# EasyEDA Pro project PET_LAB_PCB_Rev3.eprj, schematic Schematic1

## Sheets
1 P1: Board Name: Board1; Create Date: 2025-12-09; Page Name: P1; Project Name: PET_LAB_PCB_Rev3; Schematic Name: Schematic1; Update Date: 2025-12-10; Company: EasyEDA.com; Page Size: A4; Version: V2.0
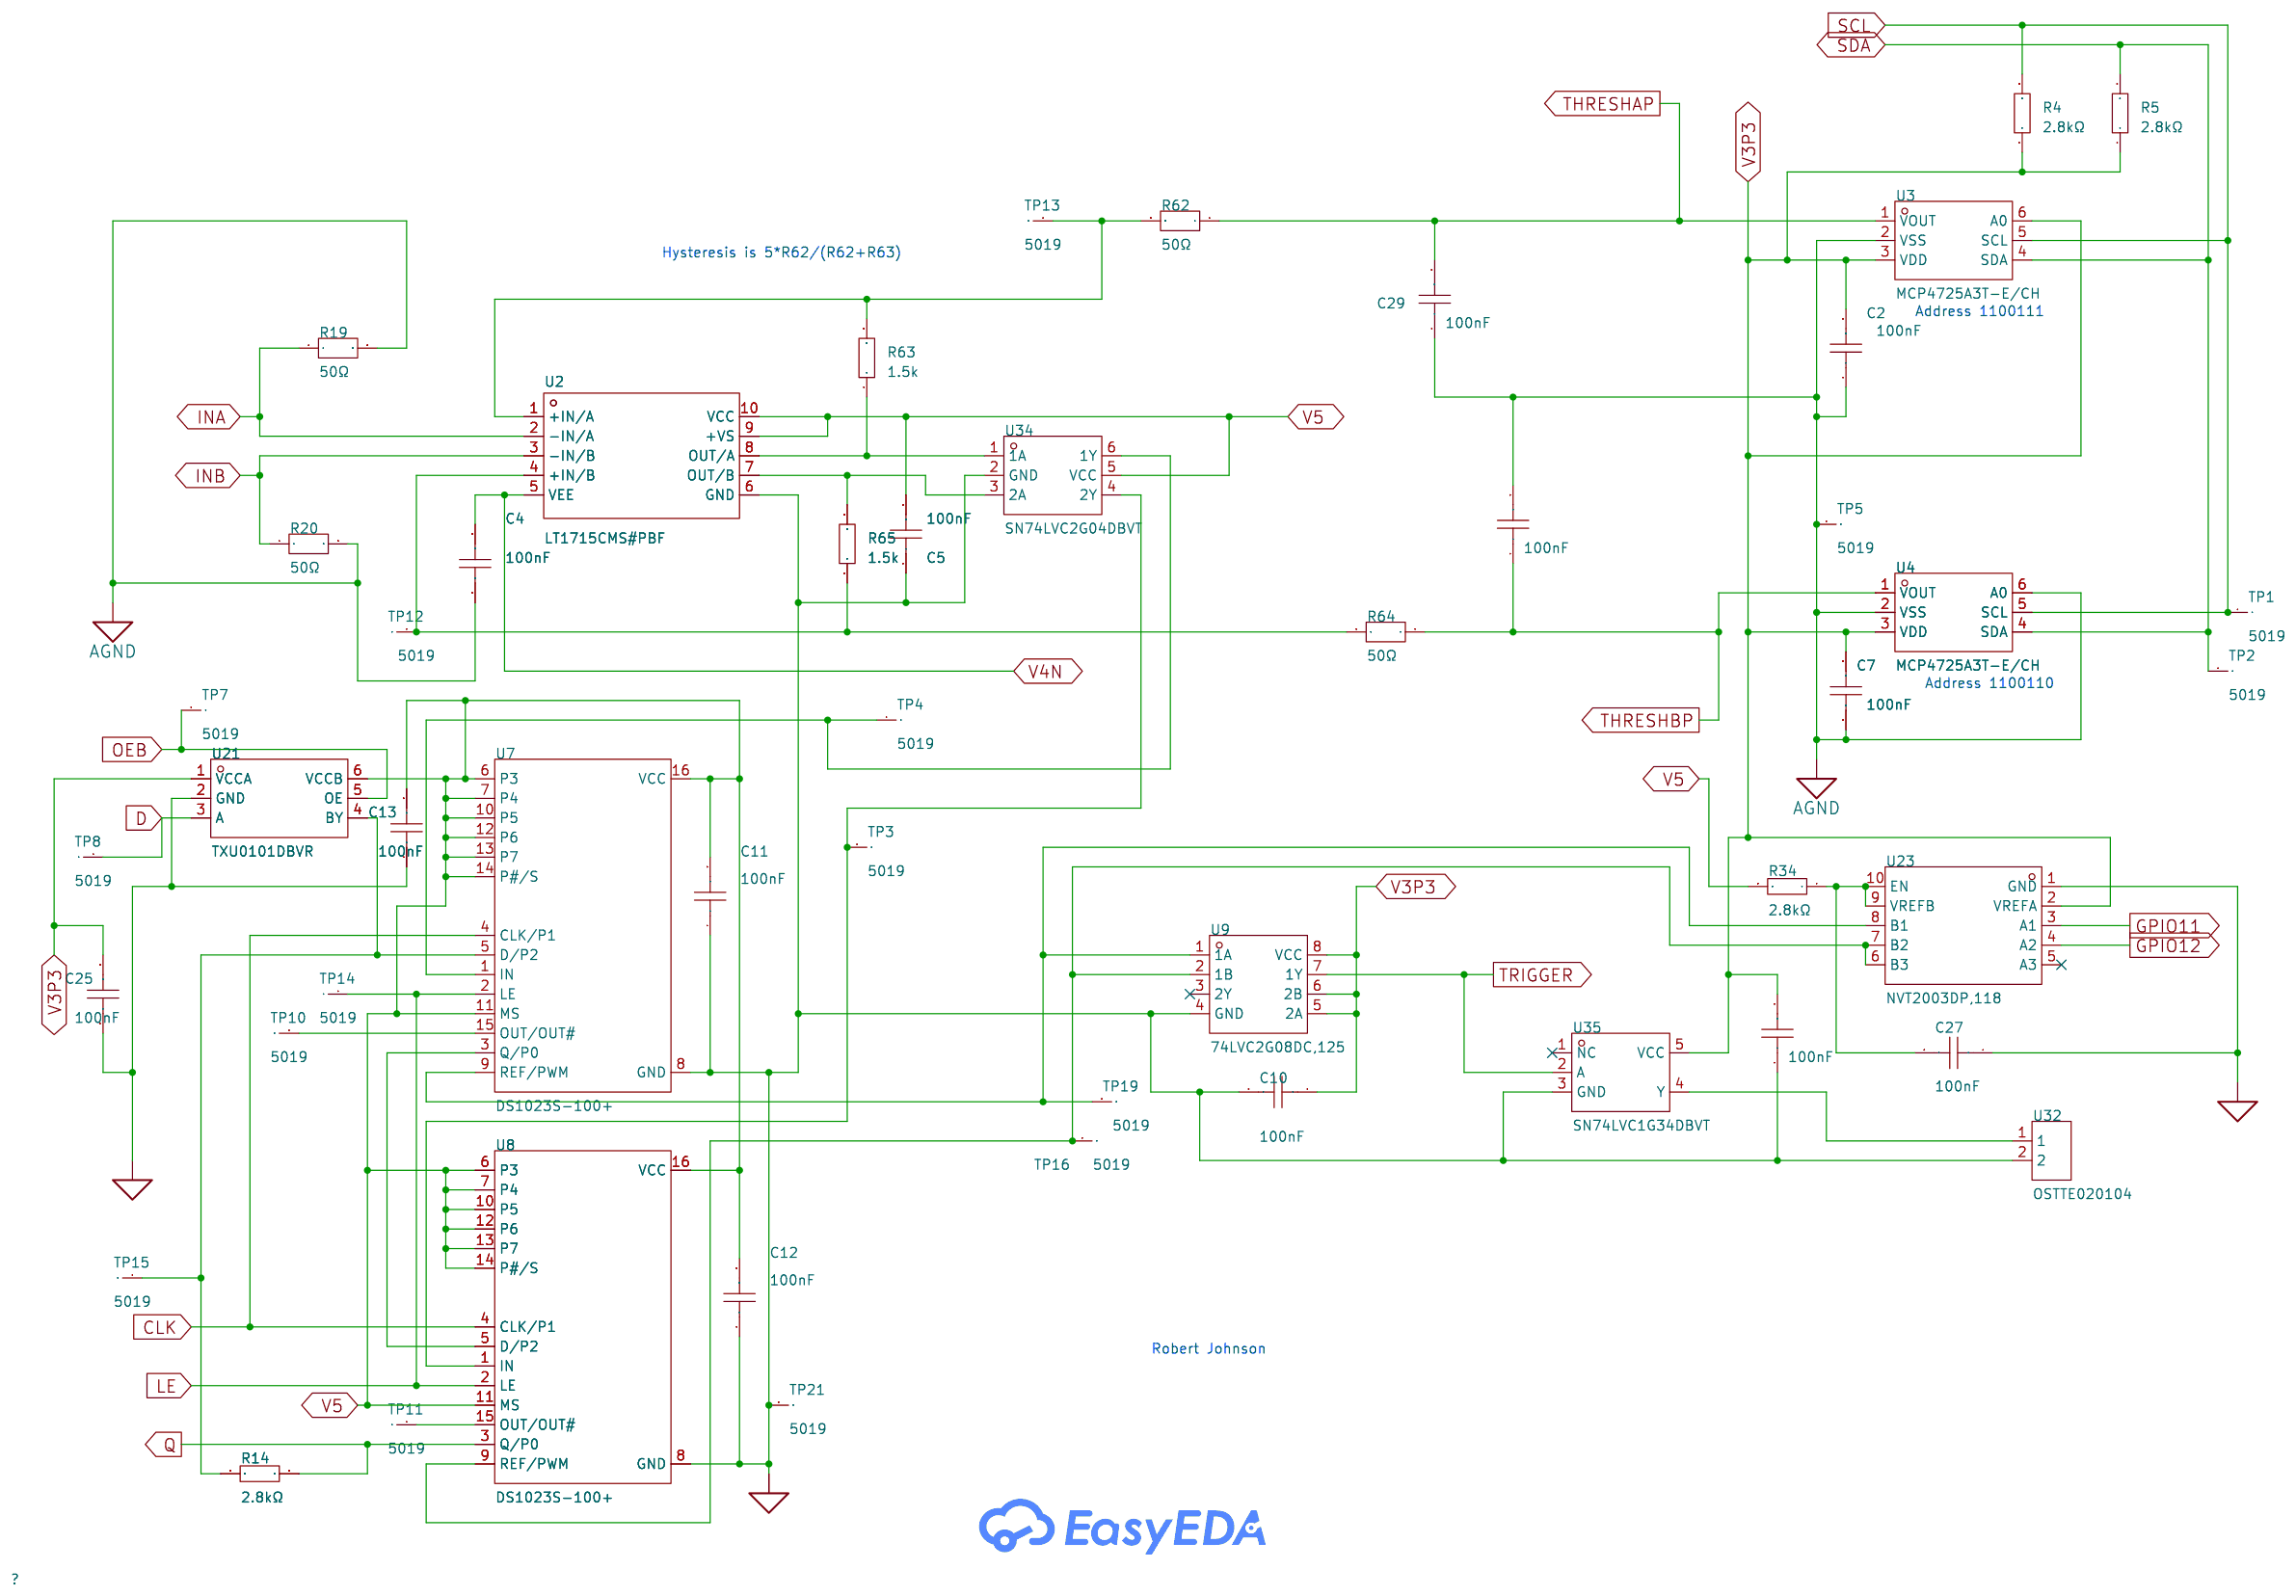
[diagram p0: P1]
2 P2: Page Name: P2; Update Date: 2026-10-26
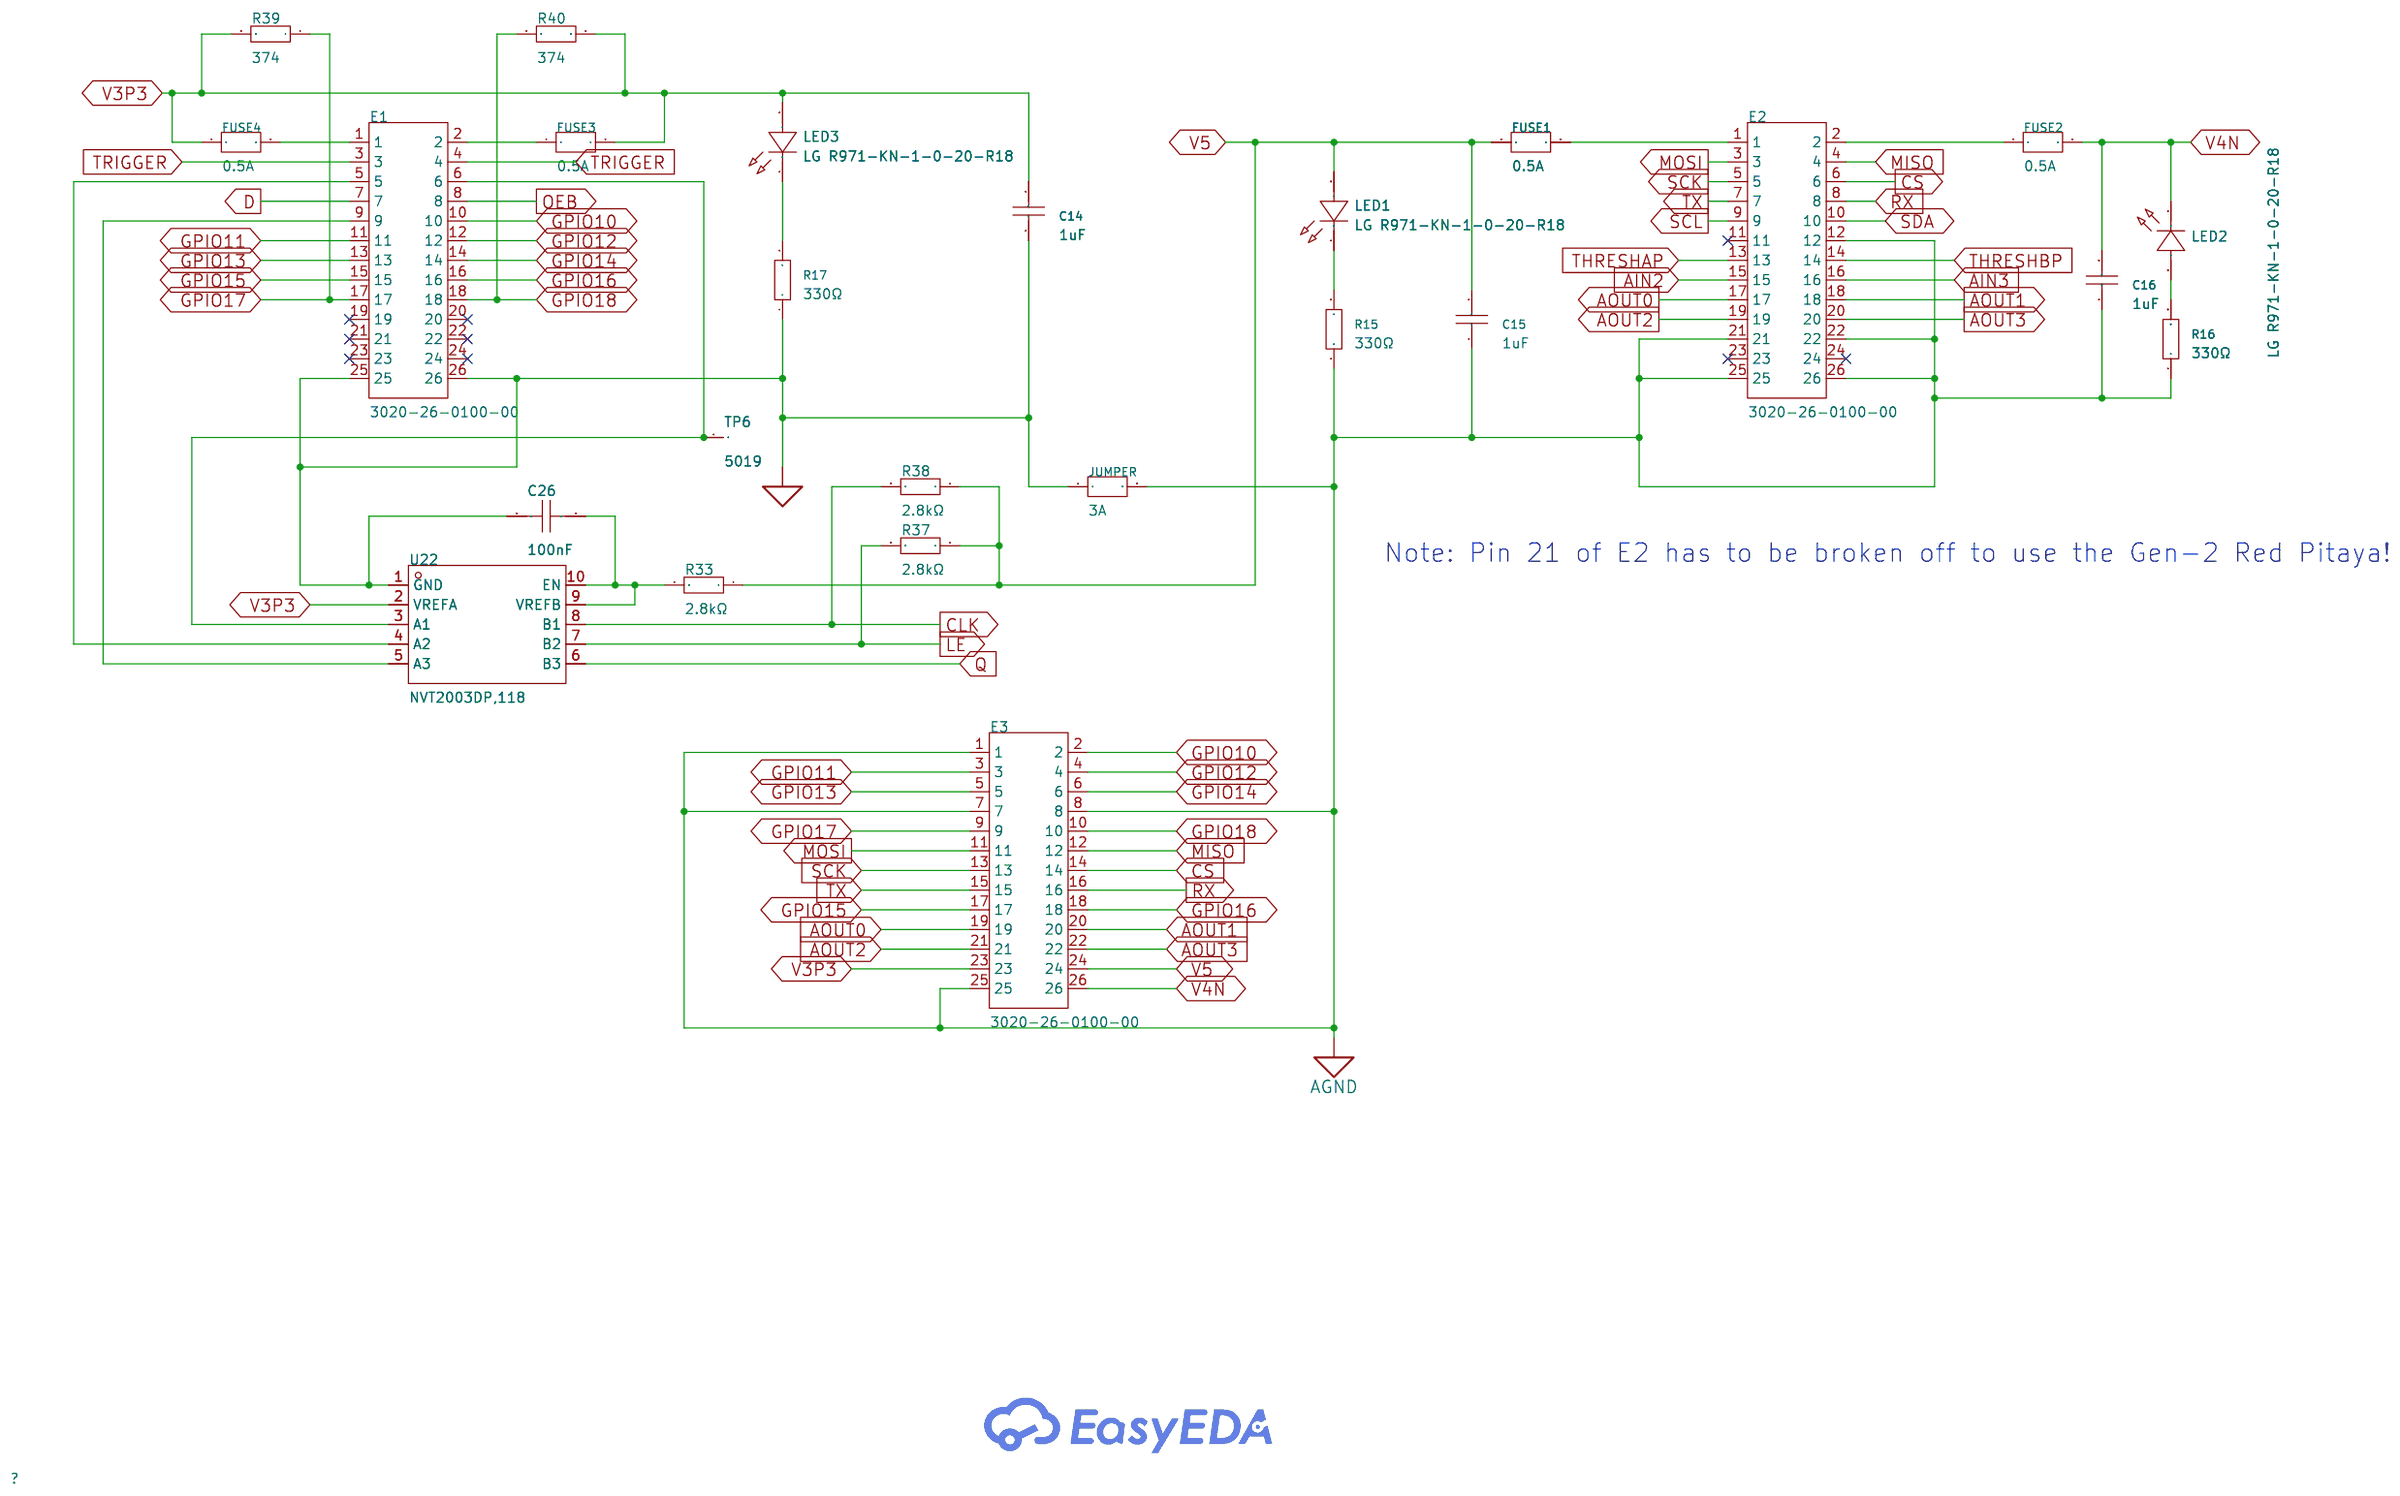
[diagram p1: P2]
3 P3: Page Name: P3
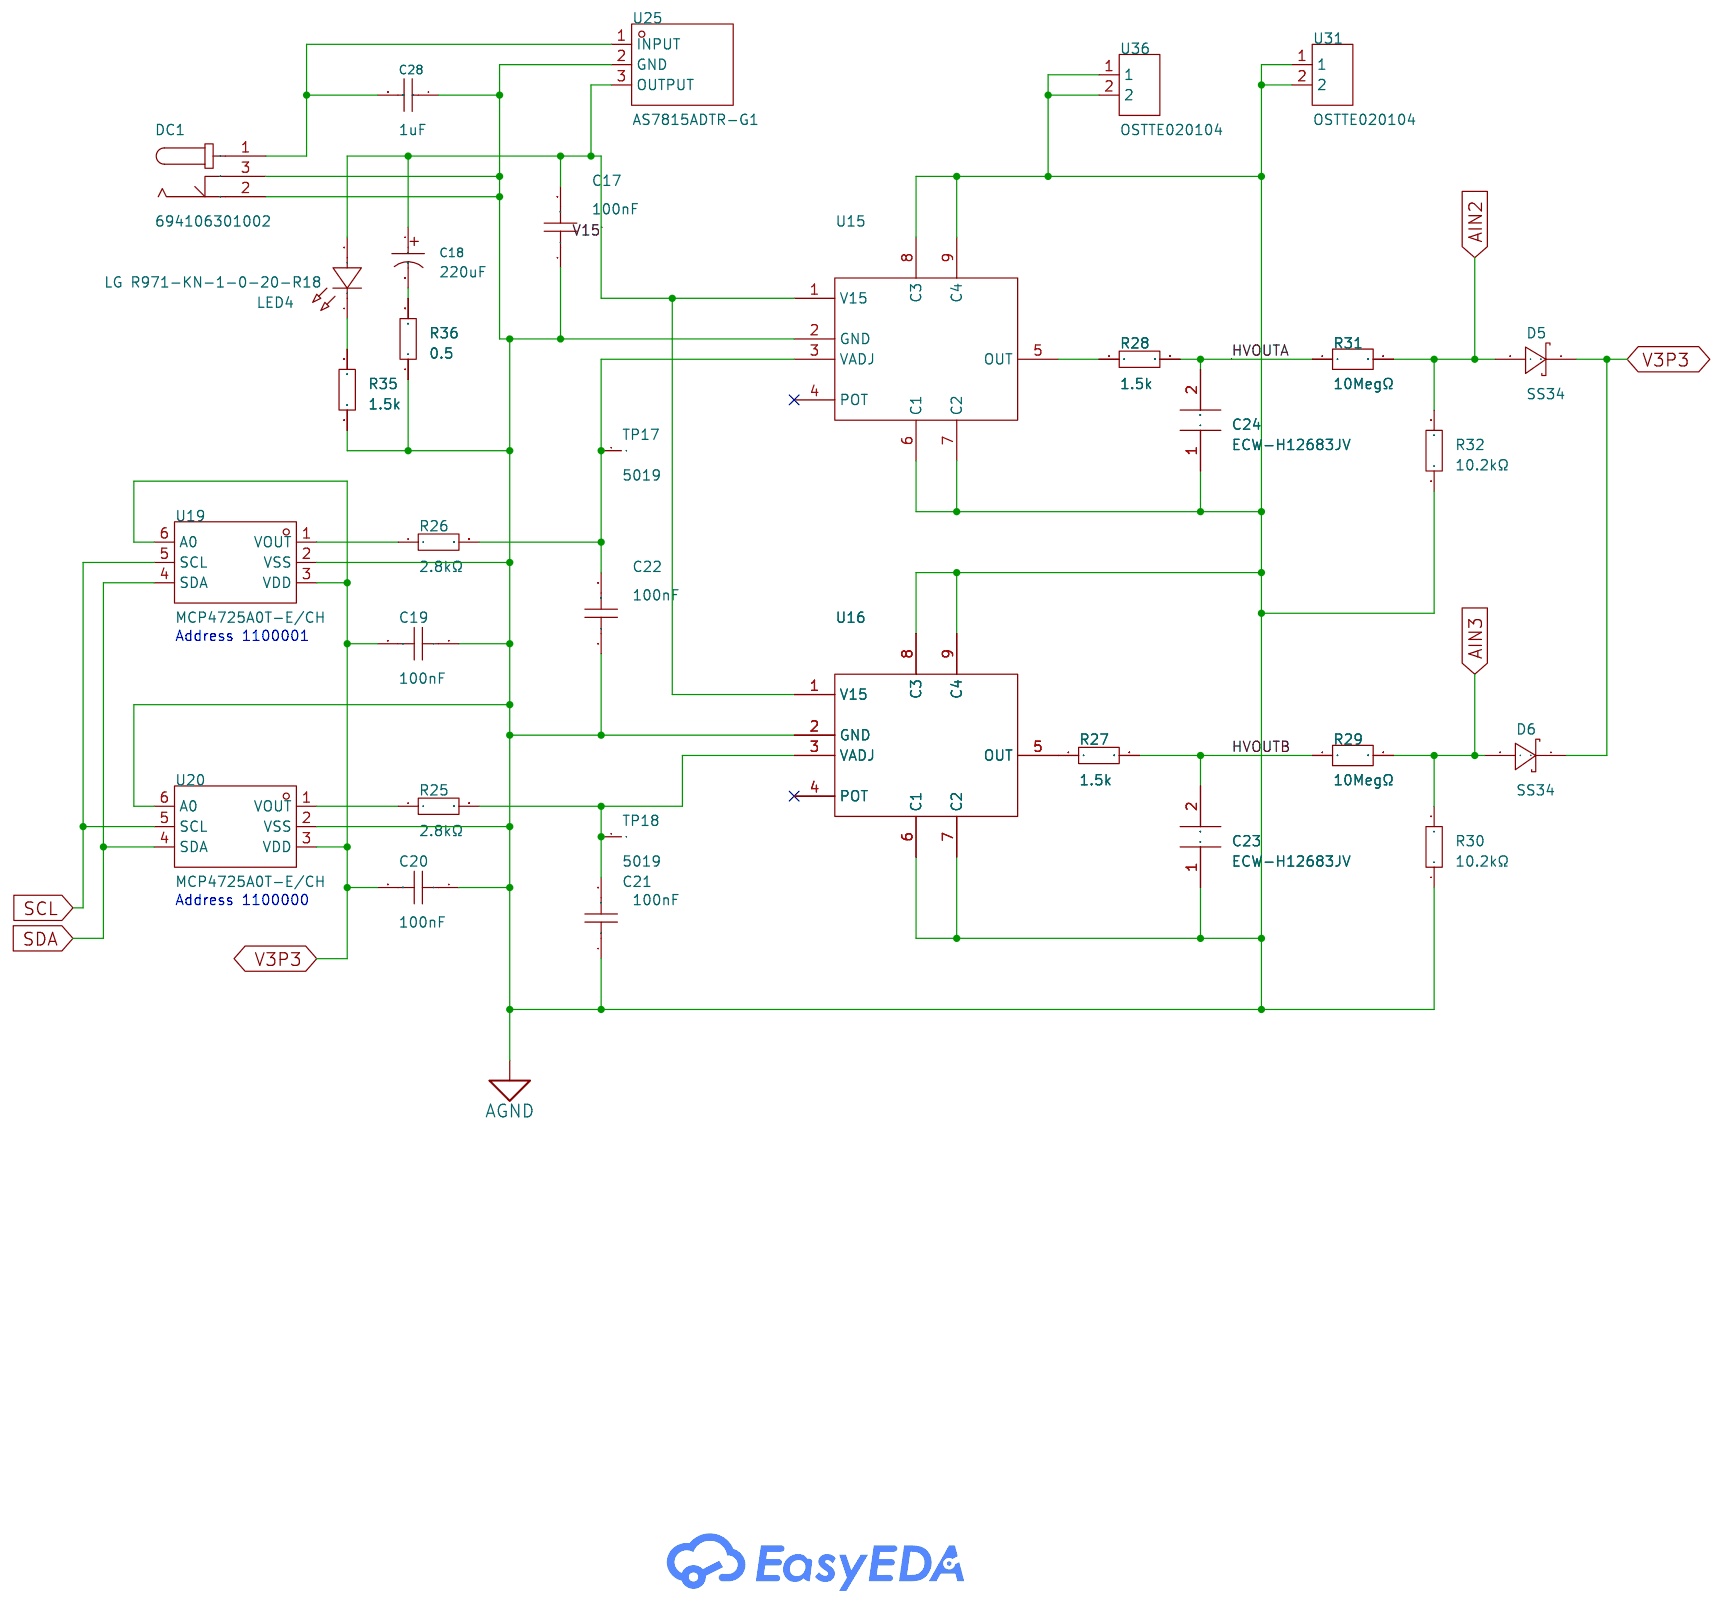
[diagram p2: P3]
4 P4: Page Name: P4; Version: V1.0
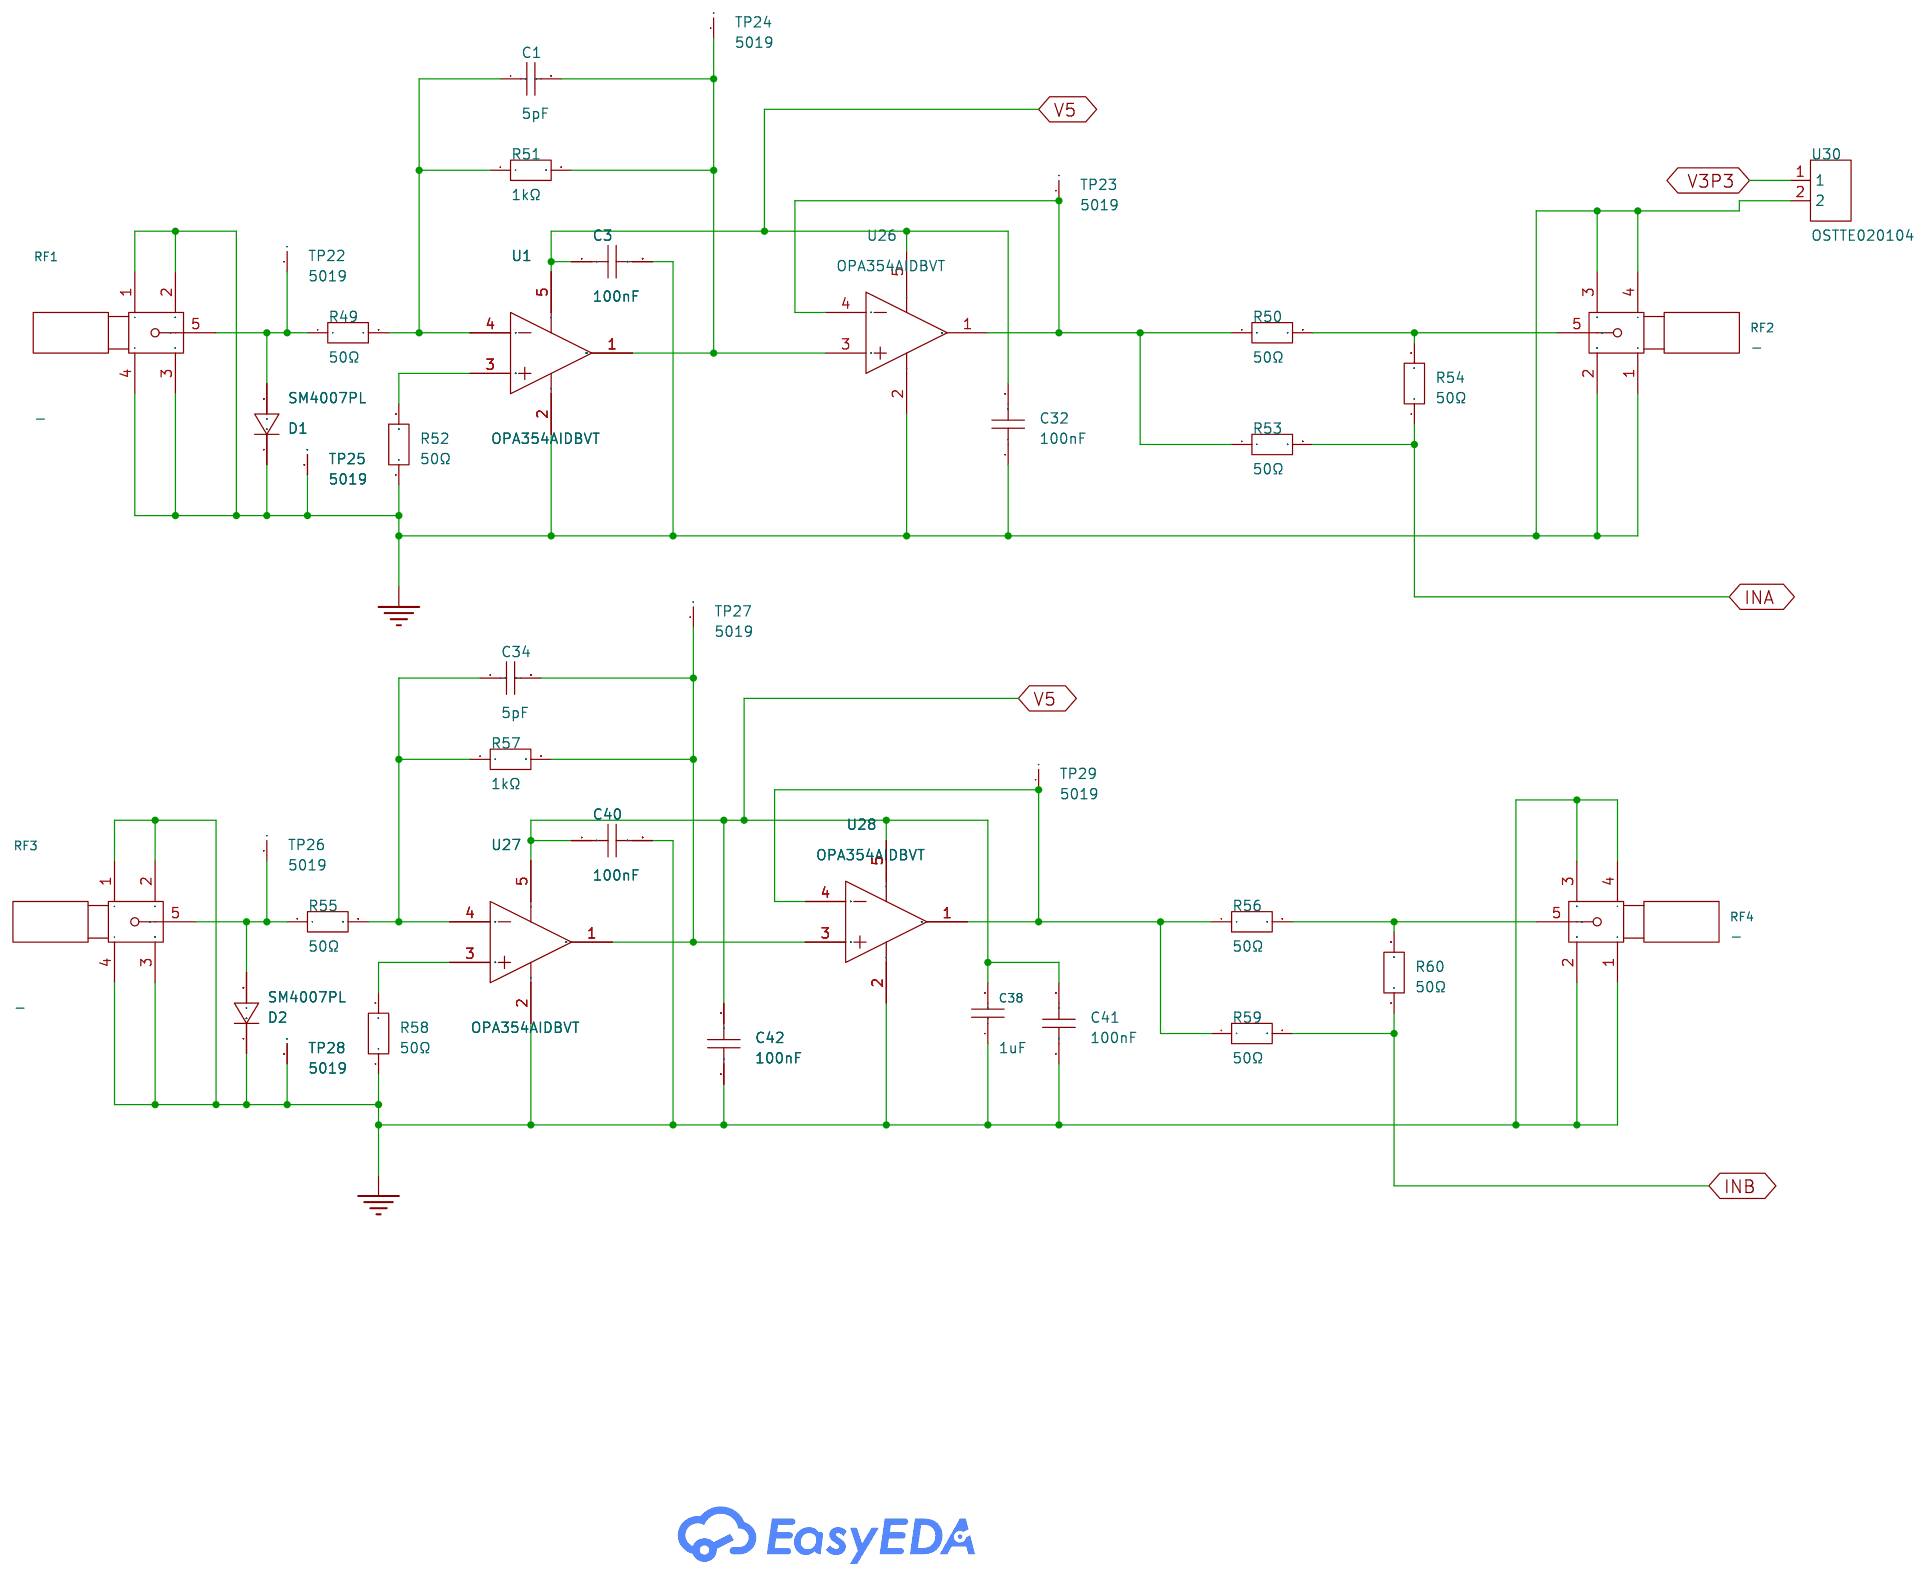
[diagram p3: P4]

## Parts
sheet P1
C2  100nF  [C0603]
C4  100nF  [C0603]
C5  100nF  [C0603]
C7  100nF  [C0603]
C10  100nF  [C0603]
C11  100nF  [C0603]
C12  100nF  [C0603]
C13  100nF  [C0603]
C25  100nF  [C0603]
C27  100nF  [C0603]
C29  100nF  [C0603]
C30  100nF  [C0603]
C39  100nF  [C0603]
R4  2.8kΩ  [R0805]
R5  2.8kΩ  [R0805]
R14  2.8kΩ  [R0805]
R19  50Ω  [R0805]
R20  50Ω  [R0805]
R34  2.8kΩ  [R0805]
R62  50Ω  [R0805]
R63  1.5k  [R0805]
R64  50Ω  [R0805]
R65  1.5k  [R0805]
TP1  5019  [CONN-SMD_5019]
TP2  5019  [CONN-SMD_5019]
TP3  5019  [CONN-SMD_5019]
TP4  5019  [CONN-SMD_5019]
TP5  5019  [CONN-SMD_5019]
TP7  5019  [CONN-SMD_5019]
TP8  5019  [CONN-SMD_5019]
TP10  5019  [CONN-SMD_5019]
TP11  5019  [CONN-SMD_5019]
TP12  5019  [CONN-SMD_5019]
TP13  5019  [CONN-SMD_5019]
TP14  5019  [CONN-SMD_5019]
TP15  5019  [CONN-SMD_5019]
TP16  5019  [CONN-SMD_5019]
TP19  5019  [CONN-SMD_5019]
TP21  5019  [CONN-SMD_5019]
U2  LT1715CMS#PBF  [MSOP-10_L3.0-W3.0-P0.50-LS5.0-TL]
U3  MCP4725A3T-E/CH  [SOT-23-6_L2.9-W1.6-P0.95-LS2.8-BR]
U4  MCP4725A3T-E/CH  [SOT-23-6_L2.9-W1.6-P0.95-LS2.8-BR]
U7  DS1023S-100+  [SOIC-16_L10.3-W7.5-P1.27-LS10.4-BL]
U8  DS1023S-100+  [SOIC-16_L10.3-W7.5-P1.27-LS10.4-BL]
U9  74LVC2G08DC,125  [VSSOP-8_L2.3-W2.0-P0.50-LS3.1-BL]
U21  TXU0101DBVR  [SOT-23-6_L2.9-W1.6-P0.95-LS2.8-BL-1]
U23  NVT2003DP,118  [TSSOP-10_L3.0-W3.0-P0.50-LS4.9-BL]
U32  OSTTE020104  [CONN-TH_2P-P3.50_OSTTE020104]
U34  SN74LVC2G04DBVT  [SOT-23-6_L2.9-W1.6-P0.95-LS2.8-BR]
U35  SN74LVC1G34DBVT  [TSOT-23-5_L2.9-W1.6-P0.95-LS2.8-BL]
sheet P2
C14  1uF  [C0805]
C15  1uF  [C0805]
C16  1uF  [C0805]
C26  100nF  [C0603]
E1  3020-26-0100-00  [HDR-TH_26P-P2.54-V-M-R2-C13-S2.54]
E2  3020-26-0100-00  [HDR-TH_26P-P2.54-V-M-R2-C13-S2.54]
E3  3020-26-0100-00  [HDR-TH_26P-P2.54-V-M-R2-C13-S2.54]
FUSE1  0.5A  [R1206]
FUSE2  0.5A  [R1206]
FUSE3  0.5A  [R1206]
FUSE4  0.5A  [R1206]
JUMPER  3A  [R1206]
LED1  LG R971-KN-1-0-20-R18  [LED0805-RD_GREEN]
LED2  LG R971-KN-1-0-20-R18  [LED0805-RD_GREEN]
LED3  LG R971-KN-1-0-20-R18  [LED0805-RD_GREEN]
R15  330Ω  [R0805]
R16  330Ω  [R0805]
R17  330Ω  [R0805]
R33  2.8kΩ  [R0805]
R37  2.8kΩ  [R0805]
R38  2.8kΩ  [R0805]
R39  374  [R0805]
R40  374  [R0805]
TP6  5019  [CONN-SMD_5019]
U22  NVT2003DP,118  [TSSOP-10_L3.0-W3.0-P0.50-LS4.9-BL]
sheet P3
C17  100nF  [C0603]
C18  220uF  [CAP-SMD_BD8.0-L8.3-W8.3-FD]
C19  100nF  [C0603]
C20  100nF  [C0603]
C21  100nF  [C0603]
C22  100nF  [C0603]
C23  0.068u  [HV_CAP_ECW-H12683JV]
C24  0.068u  [HV_CAP_ECW-H12683JV]
C28  1uF  [C0805]
D5  SS34  [SOD-323_L1.8-W1.3-LS2.5-RD]
D6  SS34  [SOD-323_L1.8-W1.3-LS2.5-RD]
DC1  694106301002  [DC-IN-TH_694106301002]
LED4  LG R971-KN-1-0-20-R18  [LED0805-RD_GREEN]
R25  2.8kΩ  [R0805]
R26  2.8kΩ  [R0805]
R27  1.5k  [R0805]
R28  1.5k  [R0805]
R29  10MegΩ  [R2512]
R30  10.2kΩ  [R0805]
R31  10MegΩ  [R2512]
R32  10.2kΩ  [R0805]
R35  1.5k  [R0805]
R36  0.5  [R0805]
TP17  5019  [CONN-SMD_5019]
TP18  5019  [CONN-SMD_5019]
U15  C9619-50  [HPK_C9619-50]
U16  C9619-50  [HPK_C9619-50]
U19  MCP4725A0T-E/CH  [SOT-23-6_L2.9-W1.6-P0.95-LS2.8-BR]
U20  MCP4725A0T-E/CH  [SOT-23-6_L2.9-W1.6-P0.95-LS2.8-BR]
U25  AS7815ADTR-G1  [TO-252-2_L6.6-W6.1-P4.57-LS9.9-BR-CW]
U31  OSTTE020104  [CONN-TH_2P-P3.50_OSTTE020104]
U36  OSTTE020104  [CONN-TH_2P-P3.50_OSTTE020104]
sheet P4
C1  5pF  [C0603]
C3  100nF  [C0603]
C32  100nF  [C0603]
C34  5pF  [C0603]
C38  1uF  [C0805]
C40  100nF  [C0603]
C41  100nF  [C0603]
C42  100nF  [C0603]
D1  SM4007PL  [SOD-123F_L2.8-W1.8-LS3.7-RD]
D2  SM4007PL  [SOD-123F_L2.8-W1.8-LS3.7-RD]
R49  50Ω  [R0603]
R50  50Ω  [R0603]
R51  1kΩ  [R0603]
R52  50Ω  [R0603]
R53  50Ω  [R0603]
R54  50Ω  [R0603]
R55  50Ω  [R0603]
R56  50Ω  [R0603]
R57  1kΩ  [R0603]
R58  50Ω  [R0603]
R59  50Ω  [R0603]
R60  50Ω  [R0603]
RF1  -  [SMA-TH_BWSMA-KWE-Z001]
RF2  -  [SMA-TH_BWSMA-KWE-Z001]
RF3  -  [SMA-TH_BWSMA-KWE-Z001]
RF4  -  [SMA-TH_BWSMA-KWE-Z001]
TP22  5019  [CONN-SMD_5019]
TP23  5019  [CONN-SMD_5019]
TP24  5019  [CONN-SMD_5019]
TP25  5019  [CONN-SMD_5019]
TP26  5019  [CONN-SMD_5019]
TP27  5019  [CONN-SMD_5019]
TP28  5019  [CONN-SMD_5019]
TP29  5019  [CONN-SMD_5019]
U1  OPA354AIDBVT  [SOT-23-5_L3.0-W1.7-P0.95-LS2.8-BR]
U26  OPA354AIDBVT  [SOT-23-5_L3.0-W1.7-P0.95-LS2.8-BR]
U27  OPA354AIDBVT  [SOT-23-5_L3.0-W1.7-P0.95-LS2.8-BR]
U28  OPA354AIDBVT  [SOT-23-5_L3.0-W1.7-P0.95-LS2.8-BR]
U30  OSTTE020104  [CONN-TH_2P-P3.50_OSTTE020104]

## Library data of the parts
C2 C4 C5 C7 C10-C13 C17 C19-C22 C25-C27 C29 C30 C39 = CC0603JRX7R7BB104: Capacitance: Tolerance:±5% Tolerance:±5% Voltage Rated: Temperature Coefficient:; LCSC Part Name: 100nF ±5% 16V; Supplier Part: 311-1344-1-ND; Manufacturer: YAGEO; Manufacturer Part: CC0603KRX7R9BB104; Supplier Footprint: 0603; JLCPCB Part Class: Extended Part; Datasheet: https://atta.szlcsc.com/upload/public/pdf/source/20170919/C131031_1505787245477976978.pdf; Supplier: Digikey; Tolerance: ±5%
R4 R5 R14 R25 R26 R33 R34 R37 R38 = AC0805FR-072K8L: Type:Thick Film Resistors Resistance: Tolerance:±1% Tolerance:±1% Power(Watts): Overload Voltage (Max): Temperature Coefficient:±100ppm/℃ Temperature Coefficient:±100ppm/℃ Operating Temperature Range:-55℃~+155℃ Operating Temperature Range:-55℃~+155℃; LCSC Part Name: 厚膜电阻 2.8kΩ ±1% 125mW; Supplier Part: RMCF0805FT2K80CT-ND; Manufacturer: Stackpole Electronics; Manufacturer Part: RMCF0805FT2K80; Supplier Footprint: 0805; JLCPCB Part Class: Extended Part; Datasheet: https://atta.szlcsc.com/upload/public/pdf/source/20181031/C228707_23E607B250457FE629CF9918DB05DE4F.pdf; Supplier: Digikey; Type: Thick Film Resistors; Tolerance: ±1%; Temperature Coefficient: ±100ppm/℃; Operating Temperature Range: -55℃~+155℃
R19 R20 R62 R64 = RC0805FR-0750RL: Type:Thick Film Resistors Resistance: Tolerance:±1% Tolerance:±1% Power(Watts): Overload Voltage (Max): Temperature Coefficient:±100ppm/℃ Temperature Coefficient:±100ppm/℃ Operating Temperature Range:-55℃~+155℃ Operating Temperature Range:-55℃~+155℃; LCSC Part Name: 厚膜电阻 50Ω ±1% 125mW; Supplier Part: 541-CRCW080550R0FKTACT-ND; Manufacturer: Vishay Dale; Manufacturer Part: CRCW080550R0FKTA; Supplier Footprint: 0805; JLCPCB Part Class: Extended Part; Datasheet: https://atta.szlcsc.com/upload/public/pdf/source/20200615/C131893_A604F8AF35D98EE84B5E22CA559D5C95.pdf; Supplier: Digikey; Type: Thick Film Resistors; Tolerance: ±1%; Temperature Coefficient: ±100ppm/℃; Operating Temperature Range: -55℃~+155℃
R27 R28 R35 R63 R65 = AC0805FR-0710K2L: Type:Thick Film Resistors Resistance: Tolerance:±1% Tolerance:±1% Power(Watts): Overload Voltage (Max): Temperature Coefficient:±100ppm/℃ Temperature Coefficient:±100ppm/℃ Operating Temperature Range:-55℃~+155℃ Operating Temperature Range:-55℃~+155℃; LCSC Part Name: 厚膜电阻 10.2kΩ ±1% 125mW; Supplier Part: 13-AC0805FR-0710K2L-ND; Manufacturer: YAGEO(国巨); Supplier Footprint: 0805; JLCPCB Part Class: Extended Part; Datasheet: https://atta.szlcsc.com/upload/public/pdf/source/20180927/C229861_4ABDC471507C1ED6AFB4BA66AFC8620A.pdf; Supplier: Digikey; Type: Thick Film Resistors; Tolerance: ±1%; Temperature Coefficient: ±100ppm/℃; Operating Temperature Range: -55℃~+155℃
TP1-TP8 TP10-TP19 TP21-TP29 = 5019: Connector Type:Iron ring type (patch) Plastic Color:No plastic Board Space (Diameter φ/ Length x Width):3mmx1.6mm; Supplier Part: 36-5019CT-ND; Manufacturer: Keystone; JLCPCB Part Class: Extended Part; Datasheet: https://atta.szlcsc.com/upload/public/pdf/source/20241111/B41DD7C4F217EFE2A4E662B9E95EFAE0.pdf; Supplier: Digikey; Connector Type: Iron ring type (patch); Plastic Color: No plastic; Board Space (Diameter φ/ Length x Width): 3mmx1.6mm
U2 = LT1715CMS#PBF: Input Offset Voltage (Vos):2.5mV Input Bias Current (Ib):6uA Input Hysteresis Voltage (Vhys):6mV Common Mode Rejection Ratio (CMRR):70dB Supply Voltage:2.7V~12V Supply Voltage:2.7V~12V Output Type:- Output Mode:TTL；CMOS Operating Temperature:0℃~+70℃ Opera; LCSC Part Name: 4纳秒，150兆赫双比较器，具有独立的输入/输出电源; Supplier Part: LT1715CMS#TRPBFCT-ND; Manufacturer: Analog Devices Inc; Supplier Footprint: MSOP-10; JLCPCB Part Class: Extended Part; Datasheet: https://atta.szlcsc.com/upload/public/pdf/source/20221018/7AC70F5A8AD203391C1E1D67A85126DA.pdf; Supplier: Digikey; Input Offset Voltage (Vos): 2.5mV; Input Bias Current (Ib): 6uA; Input Hysteresis Voltage (Vhys): 6mV; Common Mode Rejection Ratio (CMRR): 70dB; Supply Voltage: 2.7V~12V; Output Mode: TTL；CMOS; Operating Temperature: 0℃~+70℃
U3 U4 = MCP4725A3T-E/CH: Interface:I2C Number of Channels:1 Output Type:Voltage Buffer Supply Voltage:2.7V~5.5V Supply Voltage:2.7V~5.5V Resolution:12 Integral nonlinearity:±2LSB Integral nonlinearity:±2LSB Settling Time:6us Operating Temperature:-40℃~+125℃ Operating Temperature:; Supplier Part: MCP4725A3T; Manufacturer: Microchip Technology; Supplier Footprint: SOT-23-6; JLCPCB Part Class: Extended Part; Datasheet: https://atta.szlcsc.com/upload/public/pdf/source/20151029/1457707542566.pdf; Supplier: Digikey; Interface: I2C; Number of Channels: 1; Output Type: Voltage Buffer; Supply Voltage: 2.7V~5.5V; Resolution: 12; Integral nonlinearity: ±2LSB; Settling Time: 6us; Operating Temperature: -40℃~+125℃
U7 U8 = DS1023S-100+: Available Total Delays:255ns Available Total Delays:255ns Voltage - Supply:4.75V~5.25V Voltage - Supply:4.75V~5.25V Operating Temperature:0℃~+70℃ Operating Temperature:0℃~+70℃; LCSC Part Name: 8位、可编程定时单元; Supplier Part: DS1023S-100+-ND; Manufacturer: Analog Devices, Maxim; Supplier Footprint: SOIC-16-300mil; JLCPCB Part Class: Extended Part; Datasheet: https://atta.szlcsc.com/upload/public/pdf/source/20171204/C143276_15123771717071162548.pdf; Supplier: Digikey; Available Total Delays: 255ns; Voltage - Supply: 4.75V~5.25V; Operating Temperature: 0℃~+70℃
U9 = 74LVC2G08DC,125: Logic Gate Type:With Door Number of Channels:2 Supply Voltage:1.65V~5.5V Supply Voltage:1.65V~5.5V Quiescent Current (Max):4uA Sink Current:32mA Source Current:32mA High Level Range (VIH):950mV~3.4V High Level Range (VIH):950mV~3.4V Low Level Range (VIL):; Supplier Part: 1727-3560-1-ND; Manufacturer: Nexperia USA; Supplier Footprint: VSSOP-8-0.5mm; JLCPCB Part Class: Extended Part; Datasheet: https://atta.szlcsc.com/upload/public/pdf/source/20240724/336E39771739BF261E5E4E7B81FDEA55.pdf; Supplier: Digikey; Logic Gate Type: With Door; Number of Channels: 2; Supply Voltage: 1.65V~5.5V; Quiescent Current (Max): 4uA; Sink Current: 32mA; Source Current: 32mA; High Level Range (VIH): 950mV~3.4V; Low Level Range (VIL): 700mV~800mV; Series: 74LVCSeries; Propagation Delay Time: 3.8ns@5V,50pF; Operating Temperature: -40℃~+125℃
U21 = TXU0101DBVR_C7136368: Channel Type:Unidirectional Input Signal:- Output Signal:- Data Rate:200Mbps Voltage - Supply(VCCA):1.1V~5.5V Voltage - Supply(VCCA):1.1V~5.5V Voltage - Supply(VCCB):1.1V~5.5V Voltage - Supply(VCCB):1.1V~5.5V Number of Circuits:1 Number of Circuits:1 Outp; Supplier Part: 296-TXU0101DBVRCT-ND; Manufacturer: Texas Instruments; Supplier Footprint: SOT-23-6; JLCPCB Part Class: Extended Part; Datasheet: https://atta.szlcsc.com/upload/public/pdf/source/20230922/65B73DE01040482A12CA20381FF33F7A.pdf; Supplier: Digikey; Channel Type: Unidirectional; Data Rate: 200Mbps; Voltage - Supply(VCCA): 1.1V~5.5V; Voltage - Supply(VCCB): 1.1V~5.5V; Number of Circuits: 1; Output Type: Tri-State; Operating Temperature: -40℃~+125℃
U22 U23 = NVT2003DP,118: Channel Type:Bidirectional Input Signal:- Output Signal:- Data Rate:- Voltage - Supply(VCCA):1V~3.6V Voltage - Supply(VCCA):1V~3.6V Voltage - Supply(VCCB):1.8V~5.5V Voltage - Supply(VCCB):1.8V~5.5V Number of Circuits:1 Number of Circuits:3 Output Type:Ope; LCSC Part Name: 3位双向电平转换器; Supplier Part: 568-8383-1-ND; Manufacturer: NXP USA; Supplier Footprint: TSSOP-10-3mm; JLCPCB Part Class: Extended Part; Datasheet: https://www.nxp.com/docs/en/data-sheet/NVT2003_06.pdf; Supplier: Digikey; Channel Type: Bidirectional; Voltage - Supply(VCCA): 1V~3.6V; Voltage - Supply(VCCB): 1.8V~5.5V; Number of Circuits: 3; Output Type: Open Drain；Push-pull; Operating Temperature: -40℃~+85℃; Features: Automatic Direction Detection
U30-U32 U36 = OSTTE020104: Number of Positions or Pins:1x2P Pitch:3.5mm Color:Black Mounting Type:Through Hole Number of Pins:2P Number of Rows:1 Number of PINs Per Row:2 Current Rating:10A Voltage Rating (Max):125V Wire Gauge - AWG:16~26 Wire Gauge - AWG:16~26 Operating Temperatur; LCSC Part Name: 3.5mm 1x2P 排数:1 每排P数:2 直插; Supplier Part: ED2740-ND; Manufacturer: On-Shore Tech; Supplier Footprint: 插件,P=3.5mm; JLCPCB Part Class: Extended Part; Datasheet: https://item.szlcsc.com/datasheet/OSTTE020104/4385781.html; Supplier: Digikey; Number of Positions or Pins: 1x2P; Pitch: 3.5mm; Color: Black; Mounting Type: Through Hole; Number of Pins: 2P; Number of Rows: 1; Number of PINs Per Row: 2; Current Rating: 10A; Voltage Rating (Max): 125V; Wire Gauge - AWG: 16~26; Operating Temperature: -40℃~+115℃
U34 = SN74LVC2G04DBVT: Supplier Part: 296-26612-1-ND; Manufacturer: TI; Supplier Footprint: SOT-23-6; JLCPCB Part Class: Extended Part; Datasheet: https://www.ti.com/cn/lit/gpn/sn74lvc2g04; Supplier: Digikey; Voltage - Supply: 1.65V~5.5V; Quiescent Current(Iq): 10uA; Number of Circuits: 2; Number of Inputs: 2; Current - Output Low(IOL): 32mA; Current - Output High(IOH): 32mA; Input Logic Level - High: 1.7V~2V; Input Logic Level -Low: 700mV~800mV; Propagation Delay: 3.2ns@5V,50pF; Series: 74LVC Series; Operating Temperature: -40℃~+125℃
U35 = SN74LVC1G34DBVT: LCSC Part Name: 单缓冲门; Supplier Part: 296-26603-1-ND; Manufacturer: TI; Supplier Footprint: SOT-23-5; JLCPCB Part Class: Extended Part; Datasheet: https://www.ti.com/cn/lit/gpn/sn74lvc1g34; Supplier: Digikey; output type: Push-Pull; Voltage - Supply: 1.65V~5.5V; Number of Elements: 1; Number of Bits per Element: 1; Current - Output Low(IOL): 32mA; Current - Output High(IOH): 32mA; Logic Family: 74LVC; Operating Temperature: -40℃~+125℃; Quiescent Current: 1uA; Propagation Delay: 1ns@3.3V,15pF
C14-C16 C28 = CC0805KKX7R9BB105: Capacitance: Tolerance:±10% Tolerance:±10% Voltage Rated: Temperature Coefficient:; LCSC Part Name: 1uF ±10% 50V; Supplier Part: 1276-6470-1-ND; Manufacturer: Samsung; Manufacturer Part: CL21B105KBFNNNG; Supplier Footprint: 0805; JLCPCB Part Class: Extended Part; Datasheet: https://atta.szlcsc.com/upload/public/pdf/source/20181008/C309510_22F155564471FAF6A489F7D68F34234E.pdf; Supplier: Digikey; Tolerance: ±10%
E1-E3 = PZ254-2-13-Z-8.5: Pin Structure:2x13P Pitch:2.54mm Row Spacing:2.54mm Circluar Pins/Square Pins:Policy Mounting Type:Straight Number of Rows:Double Row Number of Pins:26P Current Rating:3A Voltage Rating (Max):- Length of Mating Pin:6mm Insulation Height:2.5mm Length of En; LCSC Part Name: 2x13P 间距:2.54mm 方针 直插; Supplier Part: 1175-1613-ND; Manufacturer: CNC Tech; Supplier Footprint: 插件,P=2.54mm; JLCPCB Part Class: Extended Part; Datasheet: https://atta.szlcsc.com/upload/public/pdf/source/20230609/5BA09C8BEB9B31376F8BF6032FF67CAC.pdf; Supplier: Digikey; Pin Structure: 2x13P; Pitch: 2.54mm; Row Spacing: 2.54mm; Circluar Pins/Square Pins: Policy; Mounting Type: Straight; Number of Rows: Double Row; Number of Pins: 26P; Current Rating: 3A; Length of Mating Pin: 6mm; Insulation Height: 2.5mm; Length of End Connection Pin: 3mm; Contact Material: Brass; Operating Temperature: -40℃~+105℃; Color: Black
FUSE1 FUSE2 = FRC1206P000 TS: Type:Thick Film Resistors Resistance: Tolerance:±5% Tolerance:±5% Power(Watts): Overload Voltage (Max): Operating Temperature Range:-55℃~+155℃ Operating Temperature Range:-55℃~+155℃; LCSC Part Name: 0Ω ±5% 250mW 厚膜电阻; Supplier Part: C2907406; Manufacturer: Bourns; Manufacturer Part: SF-1206S300-2; Supplier Footprint: 1206; JLCPCB Part Class: Extended Part; Datasheet: https://atta.szlcsc.com/upload/public/pdf/source/20211221/925EC7D7225764EE0046F22065062C87.pdf; Supplier: Digikey; Type: Thick Film Resistors; Tolerance: ±5%; Operating Temperature Range: -55℃~+155℃
FUSE3 FUSE4 = FRC1206P000 TS: Type:Thick Film Resistors Resistance: Tolerance:±5% Tolerance:±5% Power(Watts): Overload Voltage (Max): Operating Temperature Range:-55℃~+155℃ Operating Temperature Range:-55℃~+155℃; LCSC Part Name: 0Ω ±5% 250mW 厚膜电阻; Supplier Part: SF-1206S050-2CT-ND; Manufacturer: Bourns; Manufacturer Part: SF-1206S050-2; Supplier Footprint: 1206; JLCPCB Part Class: Extended Part; Datasheet: https://atta.szlcsc.com/upload/public/pdf/source/20211221/925EC7D7225764EE0046F22065062C87.pdf; Supplier: Digikey; Type: Thick Film Resistors; Tolerance: ±5%; Operating Temperature Range: -55℃~+155℃
JUMPER = FRC1206P000 TS: Type:Thick Film Resistors Resistance: Tolerance:±5% Tolerance:±5% Power(Watts): Overload Voltage (Max): Operating Temperature Range:-55℃~+155℃ Operating Temperature Range:-55℃~+155℃; LCSC Part Name: 0Ω ±5% 250mW 厚膜电阻; Supplier Part: SF-1206S300-2CT-ND; Manufacturer: Bourns; Manufacturer Part: SF-1206S300-2; Supplier Footprint: 1206; JLCPCB Part Class: Extended Part; Datasheet: https://atta.szlcsc.com/upload/public/pdf/source/20211221/925EC7D7225764EE0046F22065062C87.pdf; Supplier: Digikey; Type: Thick Film Resistors; Tolerance: ±5%; Operating Temperature Range: -55℃~+155℃
LED1-LED4 = LG R971-KN-1-0-20-R18: LCSC Part Name: 0805绿(雾状); Supplier Part: 475-LGR971-KN-1CT-ND; Manufacturer: OSRAM(欧司朗); Supplier Footprint: 0805; JLCPCB Part Class: Extended Part; Datasheet: https://atta.szlcsc.com/upload/public/pdf/source/20220714/F473664C33760CCD72677C49955FE686.pdf; Supplier: Digikey
R15-R17 = 0805W8J0331T5E: Type:Thick Film Resistors Resistance: Tolerance:±5% Tolerance:±5% Power(Watts): Overload Voltage (Max): Temperature Coefficient:±100ppm/℃ Temperature Coefficient:±100ppm/℃ Operating Temperature Range:-55℃~+155℃ Operating Temperature Range:-55℃~+155℃; LCSC Part Name: 330Ω ±5% 125mW 厚膜电阻; Supplier Part: CR0805-JW-331ELFCT-ND; Manufacturer: Bourns Inc; Manufacturer Part: CR0805-JW-331ELF; Supplier Footprint: 0805; JLCPCB Part Class: Extended Part; Datasheet: https://atta.szlcsc.com/upload/public/pdf/source/20200306/C422600_1E6D84923E4A46A82E41ADD87F860B5C.pdf; Supplier: Digikey; Type: Thick Film Resistors; Tolerance: ±5%; Temperature Coefficient: ±100ppm/℃; Operating Temperature Range: -55℃~+155℃
R39 R40 = AC0805FR-072K8L: Type:Thick Film Resistors Resistance: Tolerance:±1% Tolerance:±1% Power(Watts): Overload Voltage (Max): Temperature Coefficient:±100ppm/℃ Temperature Coefficient:±100ppm/℃ Operating Temperature Range:-55℃~+155℃ Operating Temperature Range:-55℃~+155℃; LCSC Part Name: 厚膜电阻 2.8kΩ ±1% 125mW; Supplier Part: C228707; Manufacturer: YAGEO; Manufacturer Part: RC0805JR-071K5L; Supplier Footprint: 0805; JLCPCB Part Class: Extended Part; Datasheet: https://atta.szlcsc.com/upload/public/pdf/source/20181031/C228707_23E607B250457FE629CF9918DB05DE4F.pdf; Supplier: Digikey; Type: Thick Film Resistors; Tolerance: ±1%; Temperature Coefficient: ±100ppm/℃; Operating Temperature Range: -55℃~+155℃
C18 = EEHZC1E221P: Capacitance: Tolerance:±20% Tolerance:±20% Rated Voltage:25V Ripple Current:240mA@100Hz Equivalent Series Resistance(ESR):27mΩ Type:混Combined物 Lifetime @ Temp:4000hrs@125℃ Operating Temperature:-55℃~+125℃ Operating Temperature:-55℃~+125℃; LCSC Part Name: 220uF ±20% 25V; Supplier Part: P15457CT-ND; Manufacturer: PANASONIC; Manufacturer Part: EEH-ZC1E221P; Supplier Footprint: SMD,D8xL10.2mm; JLCPCB Part Class: Extended Part; Datasheet: https://atta.szlcsc.com/upload/public/pdf/source/20170824/C128517_1503566131983907421.pdf; Supplier: Digikey; Tolerance: ±20%; Rated Voltage: 25V; Ripple Current: 240mA@100Hz; Equivalent Series Resistance(ESR): 27mΩ; Type: 混Combined物; Lifetime @ Temp: 4000hrs@125℃; Operating Temperature: -55℃~+125℃
C23 C24 = ECW-H12683JV: ECW-H12683JV HV capacitor by Panasonic; Supplier: Digikey; Supplier Part: P10492-ND; Manufacturer: Panasonic
D5 D6 = 1N5819WS_C191023: Forward Voltage (Vf@If):600mV@1A Reverse Voltage (Vr):40V Rectified Current:1A; LCSC Part Name: 电压:40V 电流:1A; Supplier Part: 5399-SS34CT-ND; Manufacturer: Shenzen; Supplier Footprint: SOD-323; JLCPCB Part Class: Basic Part; Datasheet: https://atta.szlcsc.com/upload/public/pdf/source/20220428/3CB86FD8D28D653594B4E35F9D5AEFD9.pdf; Supplier: Digikey; Forward Voltage (Vf@If): 600mV@1A; Reverse Voltage (Vr): 40V; Rectified Current: 1A
DC1 = 694106301002_C5441017: Supplier Part: 732-5930-ND; Manufacturer: Wurth Elektronic; Supplier Footprint: 插件; JLCPCB Part Class: Extended Part; Datasheet: https://www.we-online.com/components/products/datasheet/694106301002.pdf; Supplier: Digikey
R29 R31 = PE2512FKF7W0R5L: Type:Current Sensing Resistors Resistance:500mΩ Tolerance:±1% Tolerance:±1% Power(Watts):2W Temperature Coefficient:±100ppm/℃ Temperature Coefficient:±100ppm/℃; LCSC Part Name: 500mΩ ±1% 2W; Supplier Part: CHV2512-JW-106ELFCT-ND; Manufacturer: Bourns Inc; Manufacturer Part: CHV2512-JW-106ELF; Supplier Footprint: 2512; JLCPCB Part Class: Extended Part; Datasheet: https://atta.szlcsc.com/upload/public/pdf/source/20240304/AA92E4CDC04AA05B60276A0103FEBA1C.pdf; Supplier: Digikey; Type: Current Sensing Resistors; Tolerance: ±1%; Power(Watts): 2W; Temperature Coefficient: ±100ppm/℃
R30 R32 = AC0805FR-0710K2L: Type:Thick Film Resistors Resistance: Tolerance:±1% Tolerance:±1% Power(Watts): Overload Voltage (Max): Temperature Coefficient:±100ppm/℃ Temperature Coefficient:±100ppm/℃ Operating Temperature Range:-55℃~+155℃ Operating Temperature Range:-55℃~+155℃; LCSC Part Name: 厚膜电阻 10.2kΩ ±1% 125mW; Supplier Part: 311-10.2KCRCT-ND; Manufacturer: YAGEO; Manufacturer Part: RC0805FR-0710K2L; Supplier Footprint: 0805; JLCPCB Part Class: Extended Part; Datasheet: https://atta.szlcsc.com/upload/public/pdf/source/20180927/C229861_4ABDC471507C1ED6AFB4BA66AFC8620A.pdf; Supplier: Digikey; Type: Thick Film Resistors; Tolerance: ±1%; Temperature Coefficient: ±100ppm/℃; Operating Temperature Range: -55℃~+155℃
R36 = AC0805FR-0710K2L: Type:Thick Film Resistors Resistance: Tolerance:±1% Tolerance:±1% Power(Watts): Overload Voltage (Max): Temperature Coefficient:±100ppm/℃ Temperature Coefficient:±100ppm/℃ Operating Temperature Range:-55℃~+155℃ Operating Temperature Range:-55℃~+155℃; LCSC Part Name: 厚膜电阻 10.2kΩ ±1% 125mW; Supplier Part: 541-10737-1-ND; Manufacturer: Vishay Dale; Manufacturer Part: RCWE0805R500FKEA; Supplier Footprint: 0805; JLCPCB Part Class: Extended Part; Datasheet: https://atta.szlcsc.com/upload/public/pdf/source/20180927/C229861_4ABDC471507C1ED6AFB4BA66AFC8620A.pdf; Supplier: Digikey; Type: Thick Film Resistors; Tolerance: ±1%; Temperature Coefficient: ±100ppm/℃; Operating Temperature Range: -55℃~+155℃
U15 U16 = HPK_C9619_HV: High voltage power supply for PMT; Manufacturer: Hamamatsu Photonics
U19 U20 = MCP4725A3T-E/CH: Interface:I2C Number of Channels:1 Output Type:Voltage Buffer Supply Voltage:2.7V~5.5V Supply Voltage:2.7V~5.5V Resolution:12 Integral nonlinearity:±2LSB Integral nonlinearity:±2LSB Settling Time:6us Operating Temperature:-40℃~+125℃ Operating Temperature:; Supplier Part: MCP4725A0T; Manufacturer: MICROCHIP Technology; Supplier Footprint: SOT-23-6; JLCPCB Part Class: Extended Part; Datasheet: https://atta.szlcsc.com/upload/public/pdf/source/20151029/1457707542566.pdf; Supplier: Digikey; Interface: I2C; Number of Channels: 1; Output Type: Voltage Buffer; Supply Voltage: 2.7V~5.5V; Resolution: 12; Integral nonlinearity: ±2LSB; Settling Time: 6us; Operating Temperature: -40℃~+125℃
U25 = AS7815ADTR-G1: Output Type:Fixed Maximum Input Voltage:32V Output Voltage:15V Output Voltage:15V Output Current:1A Power Supply Rejection Ratio (PSRR):58dB@(120Hz) Dropout Voltage:2V@(1A) standby current:6mA Feature:ESD Protection；Short-Circuit  Protection；Thermal Prote; LCSC Part Name: 1A 三端正电压调节器; Supplier Part: 31-AS7815ADTR-G1CT-ND; Manufacturer: DIODES INC; Supplier Footprint: TO-252-2; JLCPCB Part Class: Extended Part; Datasheet: https://atta.szlcsc.com/upload/public/pdf/source/20200113/C127926_5A740A0D78643D1A35F9135FB23672BF.pdf; Supplier: Digikey; Output Type: Fixed; Maximum Input Voltage: 32V; Output Voltage: 15V; Output Current: 1A; Power Supply Rejection Ratio (PSRR): 58dB@(120Hz); Dropout Voltage: 2V@(1A); standby current: 6mA; Feature: ESD Protection；Short-Circuit  Protection；Thermal Protection(TSD)；Overcurrent Protection(OCP); Operating Temperature: -40℃~+125℃; Output Polarity: Positive electrode; Number of Outputs: 1
C1 C34 = 0603CG5R0C500NT: Capacitance:5pF Voltage Rating:50V Temperature Coefficient:C0G; LCSC Part Name: ±0.25pF 5pF 50V; Supplier Part: 1276-7005-1-ND; Manufacturer: Samsung; Manufacturer Part: CL10C050CB81PNC; Supplier Footprint: 0603; JLCPCB Part Class: Extended Part; Datasheet: https://item.szlcsc.com/datasheet/0603CG5R0C500NT/2025.html; Supplier: Digikey; Voltage Rating: 50V; Temperature Coefficient: C0G
C3 C32 C40-C42 = CC0603KRX7R9BB104: Capacitance:100nF Tolerance:±10% Tolerance:±10% Voltage Rating:50V Temperature Coefficient:X7R; LCSC Part Name: 100nF ±10% 50V; Supplier Part: 311-1344-1-ND; Manufacturer: YAGEO; Supplier Footprint: 0603; JLCPCB Part Class: Basic Part; Datasheet: https://item.szlcsc.com/datasheet/CC0603KRX7R9BB104/15331.html; Supplier: Digikey; Tolerance: ±10%; Voltage Rating: 50V; Temperature Coefficient: X7R
C38 = CL21B105KBFNNNE: Capacitance:1uF Tolerance:±10% Tolerance:±10% Voltage Rating:50V Temperature Coefficient:X7R; LCSC Part Name: 1uF ±10% 50V; Supplier Part: 1276-6470-1-ND; Manufacturer: Samsung; Manufacturer Part: CL21B105KBFNNNG; Supplier Footprint: 0805; JLCPCB Part Class: Basic Part; Datasheet: https://item.szlcsc.com/datasheet/CL21B105KBFNNNE/29074.html; Supplier: Digikey; Tolerance: ±10%; Voltage Rating: 50V; Temperature Coefficient: X7R
D1 D2 = SM4007PL_C64898: Diode Configuration:Independent Type Voltage - Forward(Vf@If):1.1V@1A Voltage - DC Reverse(Vr):1kV Current - Rectified:1A Reverse Leakage Current (Ir):10uA@1kV; Supplier Part: 5399-SM4007PLCT-ND; Manufacturer: MDD(辰达半导体); Supplier Footprint: SOD-123FL; JLCPCB Part Class: Basic Part; Datasheet: https://atta.szlcsc.com/upload/public/pdf/source/20241121/400BA5297D1B92A42708AD93AB64CE21.pdf; Supplier: Digikey; Diode Configuration: Independent Type; Voltage - Forward(Vf@If): 1.1V@1A; Voltage - DC Reverse(Vr): 1kV; Current - Rectified: 1A; Reverse Leakage Current (Ir): 10uA@1kV
R49 R50 R52-R56 R58-R60 = CRCW060350R0FKEA: Type:Thick Film Resistors Resistance:50Ω Tolerance:±1% Tolerance:±1% Power(Watts):100mW Temperature Coefficient:±100ppm/℃ Temperature Coefficient:±100ppm/℃ Operating Temperature:-55℃~+155℃ Operating Temperature:-55℃~+155℃; LCSC Part Name: 厚膜电阻 50Ω ±1% 100mW; Supplier Part: 541-3318-1-ND; Manufacturer: VISHAY(威世); Supplier Footprint: 0603; JLCPCB Part Class: Extended Part; Datasheet: https://item.szlcsc.com/datasheet/CRCW060350R0FKEA/904506.html; Supplier: Digikey; Type: Thick Film Resistors; Tolerance: ±1%; Power(Watts): 100mW; Temperature Coefficient: ±100ppm/℃; Operating Temperature: -55℃~+155℃
R51 R57 = FRC0603F1001TS: Type:Thick Film Resistor Resistance:1kΩ Tolerance:±1% Tolerance:±1% Power(Watts):100mW Voltage-Supply(Max):75V Temperature Coefficient:±100ppm/℃ Temperature Coefficient:±100ppm/℃ Operating Temperature:-55℃~+155℃ Operating Temperature:-55℃~+155℃; LCSC Part Name: 1kΩ ±1% 100mW 厚膜电阻; Supplier Part: RMCF0603FT1K00CT-ND; Manufacturer: Stackpole; Manufacturer Part: RMCF0603FT1K00; Supplier Footprint: 0603; JLCPCB Part Class: Extended Part; Supplier: Digikey; Type: Thick Film Resistor; Tolerance: ±1%; Power(Watts): 100mW; Voltage-Supply(Max): 75V; Temperature Coefficient: ±100ppm/℃; Operating Temperature: -55℃~+155℃
RF1-RF4 = BWSMA-KWE-Z001: Connector Type:Board Side Interface:Inner Bore Number of Ports:1 Interface Diameter:5.3mm Interface Length/Height:- Frequency:- RF Series:SMA Impedance:50Ω Style:Elbow Operating Temperature Range:- Operating Temperature Range:-; LCSC Part Name: 内孔 SMA 弯头; Supplier Part: 2073-RFPC-SMA27-F-ND; Manufacturer: GCT; Manufacturer Part: RFPC-SMA27-F; Supplier Footprint: 插件; JLCPCB Part Class: Extended Part; Datasheet: https://item.szlcsc.com/datasheet/BWSMA-KWE-Z001/508500.html; Supplier: Digikey; Connector Type: Board Side; Interface: Inner Bore; Number of Ports: 1; Interface Diameter: 5.3mm; RF Series: SMA; Impedance: 50Ω; Style: Elbow
U1 U26 U28 = OPA354AIDBVT: Number of Channels:Single channel Gain Bandwidth Product:100MHz Ib - Input Bias Current:3pA Slew Rate:150V/us -3dB Bandwidth:250MHz Output Current:100mA Output Type:- Rail to Rail:- Quiescent Current per Amplifier:4.9mA Operating Temperature:-40℃~+125℃ Op; LCSC Part Name: 250 MHz带宽、轨到轨输入输出CMOS运算放大器; Supplier Part: 296-13033-1-ND; Manufacturer: TI; Supplier Footprint: SOT-23-5; JLCPCB Part Class: Extended Part; Datasheet: https://www.ti.com/cn/lit/gpn/opa354; Supplier: Digikey; Number of Channels: Single channel; Gain Bandwidth Product: 100MHz; Ib - Input Bias Current: 3pA; Slew Rate: 150V/us; -3dB Bandwidth: 250MHz; Output Current: 100mA; Quiescent Current per Amplifier: 4.9mA; Operating Temperature: -40℃~+125℃
U27 = OPA354AIDBVT: Number of Channels:Single channel Gain Bandwidth Product:100MHz Ib - Input Bias Current:3pA Slew Rate:150V/us -3dB Bandwidth:250MHz Output Current:100mA Output Type:- Rail to Rail:- Quiescent Current per Amplifier:4.9mA Operating Temperature:-40℃~+125℃ Op; LCSC Part Name: 250 MHz带宽、轨到轨输入输出CMOS运算放大器; Supplier Part: C1335296-13033-1-ND50; Manufacturer: TI; Supplier Footprint: SOT-23-5; JLCPCB Part Class: Extended Part; Datasheet: https://www.ti.com/cn/lit/gpn/opa354; Supplier: Digikey; Number of Channels: Single channel; Gain Bandwidth Product: 100MHz; Ib - Input Bias Current: 3pA; Slew Rate: 150V/us; -3dB Bandwidth: 250MHz; Output Current: 100mA; Quiescent Current per Amplifier: 4.9mA; Operating Temperature: -40℃~+125℃

## Nets
AGND: C2.1 C3.2 C4.1 C7.1 C15.1 C16.1 C17.1 C19.1 C20.1 C21.1 C22.1 C23.1 C24.1 C28.1 C29.1 C30.2 C32.1 C38.1 C40.2 C41.1 C42.1 D1.1(C) D2.1(C) DC1.2 DC1.3 E2.12 E2.21 E2.22 E2.25 E2.26 E3.1 E3.7 E3.8 E3.25 JUMPER.2 R15.1 R16.1 R19.2 R20.2 R30.1 R32.1 R35.1 R36.1 R52.1 R58.1 RF1.1 RF1.2 RF1.3 RF1.4 RF2.1 RF2.2 RF2.3 RF2.4 RF3.1 RF3.2 RF3.3 RF3.4 RF4.1 RF4.2 RF4.3 RF4.4 TP5.1 TP25.1 TP28.1 U1.2(V-) U3.2(VSS) U4.2(VSS) U4.6(A0) U15.2(GND) U15.6(C1) U15.7(C2) U15.8(C3) U15.9(C4) U16.2(GND) U16.6(C1) U16.7(C2) U16.8(C3) U16.9(C4) U19.2(VSS) U20.2(VSS) U20.6(A0) U25.2(GND) U26.2(V-) U27.2(V-) U28.2(V-) U30.2 U31.1 U31.2 U36.1 U36.2
DGND: C5.1 C10.2 C11.1 C12.1 C13.1 C14.1 C25.1 C26.2 C27.1 C39.1 E1.25 E1.26 JUMPER.1 R17.1 TP21.1 U2.6(GND) U7.8(GND) U8.8(GND) U9.4(GND) U21.2(GND) U22.1(GND) U23.1(GND) U32.2 U34.2(GND) U35.3(GND)
V3P3: C2.2 C7.2 C10.1 C14.2 C19.2 C20.2 C25.2 C39.2 D5.1(K) D6.1(K) E3.23 FUSE3.2 FUSE4.1 LED3.2(A) R4.1 R5.1 R39.2 R40.1 U3.3(VDD) U3.6(A0) U4.3(VDD) U9.5(2A) U9.6(2B) U9.8(VCC) U19.3(VDD) U19.6(A0) U20.3(VDD) U21.1(VCCA) U22.2(VREFA) U23.2(VREFA) U30.1 U35.5(VCC)
V4N: C4.2 C16.2 E3.26 FUSE2.2 LED2.1(K) U2.5(VEE)
V5: C3.1 C5.2 C11.2 C12.2 C13.2 C15.2 C32.2 C38.2 C40.1 C41.2 C42.2 E3.24 FUSE1.1 LED1.2(A) R33.1 R34.2 R37.1 R38.1 U1.5(V+) U2.9(+VS) U2.10(VCC) U7.6(P3) U7.7(P4) U7.10(P5) U7.11(MS) U7.12(P6) U7.13(P7) U7.14(P#/S) U7.16(VCC) U8.6(P3) U8.7(P4) U8.10(P5) U8.11(MS) U8.12(P6) U8.13(P7) U8.14(P#/S) U8.16(VCC) U21.6(VCCB) U26.5(V+) U27.5(V+) U28.5(V+) U34.5(VCC)
V15: C17.2 C18.1 LED4.2(A) U15.1(V15) U16.1(V15) U25.3(OUTPUT)
AIN2: D5.2(A) E2.15 R31.2 R32.2
AIN3: D6.2(A) E2.16 R29.2 R30.2
AOUT0: E2.17 E3.19
AOUT1: E2.18 E3.20
AOUT2: E2.19 E3.21
AOUT3: E2.20 E3.22
CLK: R38.2 U7.4(CLK/P1) U8.4(CLK/P1) U22.8(B1)
CS: E2.6 E3.14
D: E1.7 TP8.1 U21.3(A)
GPIO10: E1.10 E3.2
GPIO11: E1.11 E3.3 U23.3(A1)
GPIO12: E1.12 E3.4 U23.4(A2)
GPIO13: E1.13 E3.5
GPIO14: E1.14 E3.6
GPIO15: E1.15 E3.17
GPIO16: E1.16 E3.18
GPIO17: E1.17 E3.9 R39.1
GPIO18: E1.18 E3.10 R40.2
HVOUTA: C24.2 R28.2 R31.1
HVOUTB: C23.2 R27.2 R29.1
INA: R19.1 R53.2 R54.1 U2.2(-IN/A)
INB: R20.1 R59.2 R60.1 U2.3(-IN/B)
LE: R37.2 TP14.1 U7.2(LE) U8.2(LE) U22.7(B2)
MISO: E2.4 E3.12
MOSI: E2.3 E3.11
OEB: E1.8 TP7.1 U21.5(OE)
Q: R14.1 U8.3(Q/P0) U22.6(B3)
RX: E2.8 E3.16
SCK: E2.5 E3.13
SCL: E2.9 R4.2 TP1.1 U3.5(SCL) U4.5(SCL) U19.5(SCL) U20.5(SCL)
SDA: E2.10 R5.2 TP2.1 U3.4(SDA) U4.4(SDA) U19.4(SDA) U20.4(SDA)
THRESHAP: C29.2 E2.13 R62.1 U3.1(VOUT)
THRESHBP: C30.1 E2.14 R64.1 U4.1(VOUT)
TRIGGER: E1.3 E1.4 U9.7(1Y) U35.2(A)
TX: E2.7 E3.15
$1N1458: TP19.1 U7.9(REF/PWM) U9.1(1A) U23.8(B1)
$1N1466: TP16.1 U8.9(REF/PWM) U9.2(1B) U23.6(B3) U23.7(B2)
$1N4776: R14.2 TP15.1 U7.5(D/P2) U21.4(BY)
$1N4823: U7.3(Q/P0) U8.5(D/P2)
$1N8755: TP10.1 U7.15(OUT/OUT#)
$1N8787: TP11.1 U8.15(OUT/OUT#)
$1N21446: C27.2 R34.1 U23.9(VREFB) U23.10(EN)
$1N39256: TP4.1 U7.1(IN) U34.6(1Y)
$1N39259: R65.2 U2.7(OUT/B) U34.3(2A)
$1N39265: TP3.1 U8.1(IN) U34.4(2Y)
$1N39491: R63.1 U2.8(OUT/A) U34.1(1A)
$1N39501: R62.2 R63.2 TP13.1 U2.1(+IN/A)
$1N39901: R64.2 R65.1 TP12.1 U2.4(+IN/B)
$1N41500: U32.1 U35.4(Y)
$2N958: E2.1 FUSE1.2
$2N1034: LED1.1(K) R15.2
$2N1198: E2.2 FUSE2.1
$2N1208: LED2.2(A) R16.2
$2N1401: E1.2 FUSE3.1
$2N1405: E1.1 FUSE4.2
$2N1524: LED3.1(K) R17.2
$2N1645: E1.5 U22.4(A2)
$2N1650: E1.6 TP6.1 U22.3(A1)
$2N1747: E1.9 U22.5(A3)
$2N9413: C26.1 R33.2 U22.9(VREFB) U22.10(EN)
$3N885: C22.2 R26.2 TP17.1 U15.3(VADJ)
$3N893: C21.2 R25.2 TP18.1 U16.3(VADJ)
$3N1446: R25.1 U20.1(VOUT)
$3N1590: R26.1 U19.1(VOUT)
$3N1744: R27.1 U16.5(OUT)
$3N1858: R28.1 U15.5(OUT)
$3N7871: LED4.1(K) R35.2
$3N8709: C28.2 DC1.1 U25.1(INPUT)
$3N9005: C18.2 R36.2
$4N780: C1.2 R51.2 TP24.1 U1.1(OUT) U26.3(IN+)
$4N781: R50.1 R53.1 TP23.1 U26.1(OUT) U26.4(IN-)
$4N782: C1.1 R49.2 R51.1 U1.4(IN-)
$4N783: D1.2(A) R49.1 RF1.5 TP22.1
$4N784: R50.2 R54.2 RF2.5
$4N788: R52.2 U1.3(IN+)
$4N1883: C34.2 R57.2 TP27.1 U27.1(OUT) U28.3(IN+)
$4N1884: R56.1 R59.1 TP29.1 U28.1(OUT) U28.4(IN-)
$4N1894: C34.1 R55.2 R57.1 U27.4(IN-)
$4N1895: D2.2(A) R55.1 RF3.5 TP26.1
$4N1896: R56.2 R60.2 RF4.5
$4N1955: R58.2 U27.3(IN+)

Not connected (* = marked no-connect by the designer): E1 19* 20* 21* 22* 23* 24*; E2 11* 23* 24*; U9 3(2Y)*; U15 4(POT)*; U16 4(POT)*; U23 5(A3)*; U35 1(NC)*

## Notes on the sheets
sheet 1
- Hysteresis is 5*R62/(R62+R63)
- Address 1100111
- Address 1100110
- Robert Johnson
sheet 2
- Note: Pin 21 of E2 has to be broken off to use the Gen-2 Red Pitaya!
sheet 3
- Address 1100001
- Address 1100000
